# Altium project 24V-70A-Power-Board-v1.0.PrjPcb (part 4 of 8)
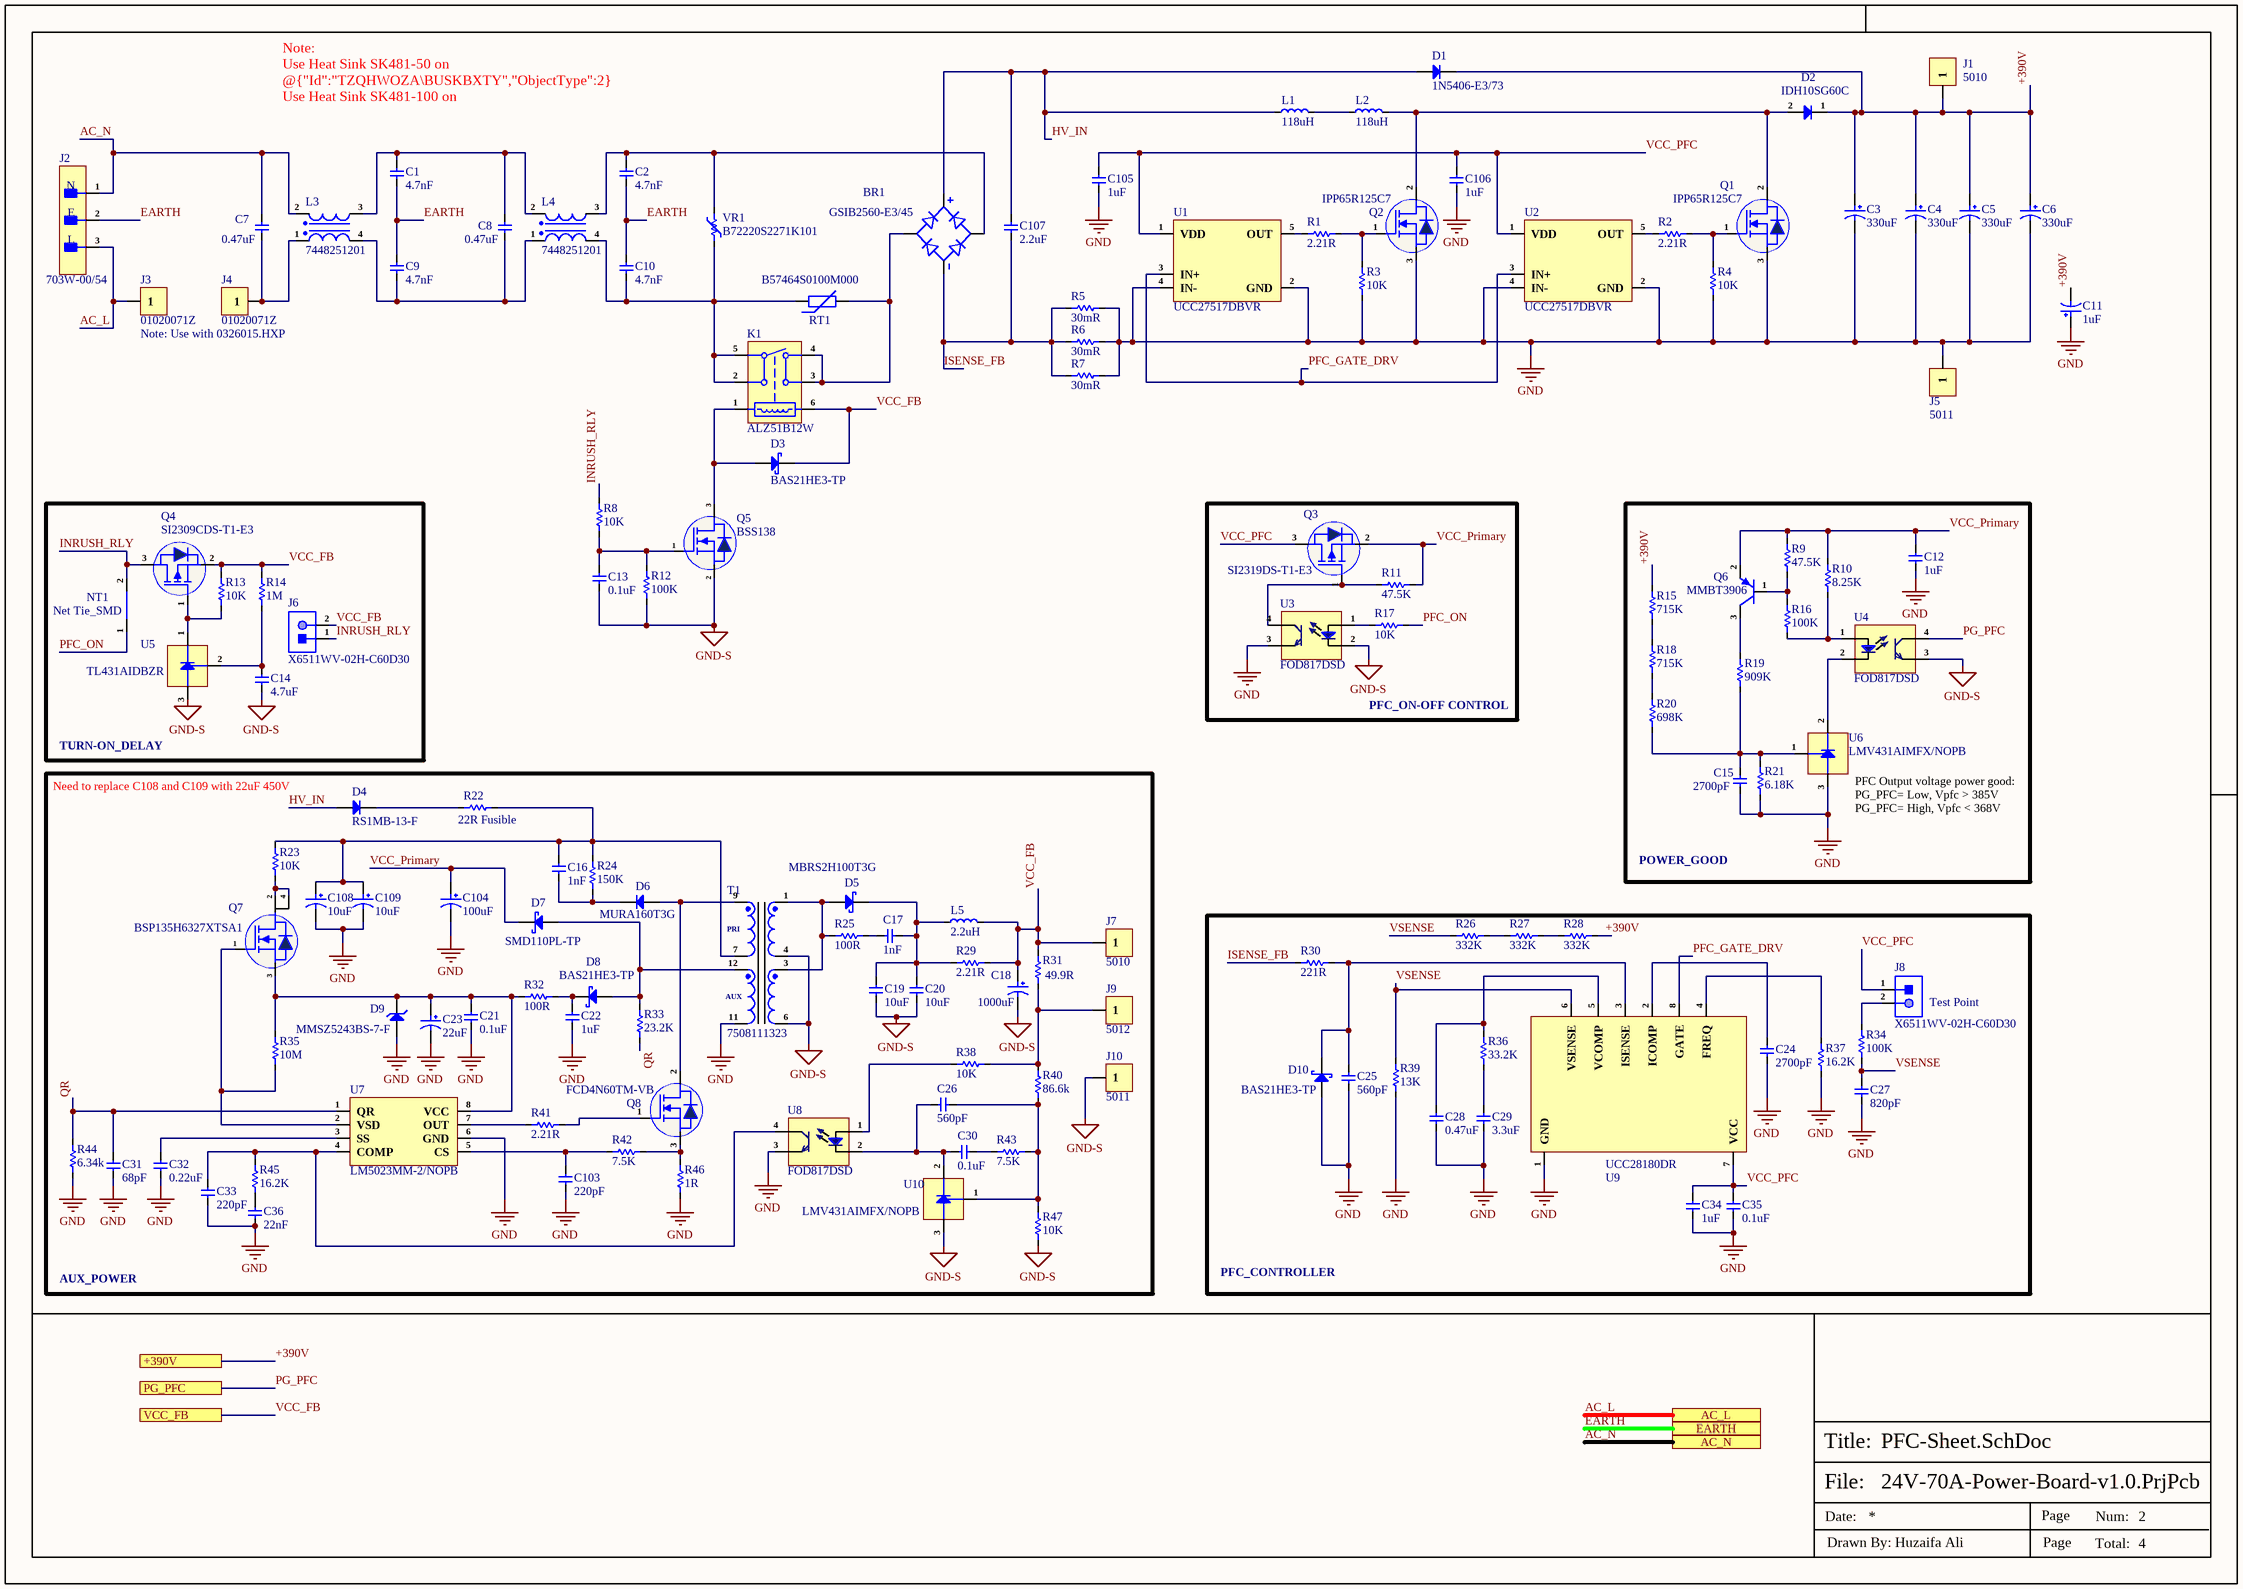
[diagram p6: PFC-Sheet.SchDoc]

## Sheet PFC-Sheet.SchDoc (continued)
### Library data of the parts
BR1 = GSIB2560-E3/45: BRIDGE RECT 1P 600V 3.5A GSIB-5S; Manufacturer: Vishay Semiconductors; Item Type: Bridge Rectifier; Supplier: Mouser; LCSC Part Number: C2838498; Manufacturer Part Number: GSIB2560-E3/45; RoHS: Yes; Stock: 2131; Pricing: 1=2.95, 10=2.01, 50=2.01, 100=1.62, 1000=1.5, 10000=1.49 (USD); ComponentLink1URL: https://datasheet.ciiva.com/4238/gsib25xx-4238464.pdf?src-supplier=Arrow+Electronics; ComponentLink1Description: https://datasheet.ciiva.com/4238/gsib25xx-4238464.pdf?src-supplier=Arrow+Electronics; ComponentLink2URL: https://datasheet.ciiva.com/4238/gsib25xx-4238478.pdf?src-supplier=Arrow+Electronics; ComponentLink2Description: https://datasheet.ciiva.com/4238/gsib25xx-4238478.pdf?src-supplier=Arrow+Electronics; ComponentLink3URL: https://datasheet.ciiva.com/17099/gsib2560-e3-45-17099405.pdf?src-supplier=Allied+Electronics; ComponentLink3Description: https://datasheet.ciiva.com/17099/gsib2560-e3-45-17099405.pdf?src-supplier=Allied+Electronics; ComponentLink4URL: https://datasheet.ciiva.com/15145/getdatasheetpartid-91689-15145262.pdf?src-supplier=Verical; ComponentLink4Description: https://datasheet.ciiva.com/15145/getdatasheetpartid-91689-15145262.pdf?src-supplier=Verical; ComponentLink5URL: https://datasheet.ciiva.com/26323/gsib25xx-26323910.pdf?src-supplier=Element14; ComponentLink5Description: https://datasheet.ciiva.com/26323/gsib25xx-26323910.pdf?src-supplier=Element14; ComponentLink6URL: https://datasheet.ciiva.com/1175/gsib25xx-1175169.pdf?src-supplier=Element14; ComponentLink6Description: https://datasheet.ciiva.com/1175/gsib25xx-1175169.pdf?src-supplier=Element14; ComponentLink7URL: https://datasheet.ciiva.com/11196/gsib25xx-11196312.pdf?src-supplier=Avnet; ComponentLink7Description: https://datasheet.ciiva.com/11196/gsib25xx-11196312.pdf?src-supplier=Avnet; ComponentLink8URL: https://datasheet.ciiva.com/885/gsib25xx-885637.pdf?src-supplier=Digikey; ComponentLink8Description: https://datasheet.ciiva.com/885/gsib25xx-885637.pdf?src-supplier=Digikey; ComponentLink9URL: https://datasheet.ciiva.com/16387/gsib20xx-16387863.pdf?src-supplier=Future+Electronics; ComponentLink9Description: https://datasheet.ciiva.com/16387/gsib20xx-16387863.pdf?src-supplier=Future+Electronics
C1 C2 C9 C10 = C771U472MYWDBA7317: CAP CER 4.7NF X1/Y2 400V/250V; Manufacturer: KEMET; Item Type: Capacitors; Supplier: Mouser; Supplier Part Number: 80-C771U472MYWDB7317; Manufacturer Part Number: C771U472MYWDBA7317; RoHS: Yes; Stock: 2909; Pricing: 1=0.96, 10=0.607, 50=0.607, 100=0.495, 1000=0.342, 10000=0.307 (USD); RoHS Compliant: Yes
C3-C6 = 381LR331M450K052: CAP ALUM 330UF 20% 450V SNAP TH; Manufacturer: Cornell Dubilier; Item Type: Aluminum Electrolytic Capacitors; Supplier: Digikey; Manufacturer Part Number: 381LR331M450K052; RoHS: Yes; Stock: 7391; Pricing: 1=8.38, 10=5.898, 50=4.8932, 100=4.6875 (USD); ComponentLink1URL: https://datasheet.ciiva.com/101/381lr-101261.pdf?src-supplier=Digikey; ComponentLink1Description: https://datasheet.ciiva.com/101/381lr-101261.pdf?src-supplier=Digikey; ComponentLink2URL: https://datasheet.ciiva.com/5373/381lr-5373947.pdf?src-supplier=Mouser; ComponentLink2Description: https://datasheet.ciiva.com/5373/381lr-5373947.pdf?src-supplier=Mouser
C7 C8 = B32933A3474M000: CAP FILM 0.47UF 20% 305VAC RAD; Manufacturer: TDK EPCOS; Item Type: Capacitors; Dielectric Material: Polyester; Value: 470nF; Ratings: AEC-Q200,X2; Supplier: Digikey; Supplier Part Number: 495-75595-ND; Manufacturer Part Number: B32933A3474M000; RoHS: Yes; Stock: 1785; Pricing: 1=1.25, 10=0.938, 50=0.8558, 100=0.701, 510=0.55953, 1020=0.4937, 2550=0.46078, 5100=0.45713 (USD); Case/Package: Radial; Series: B32933; Termination: PC Pins; RoHS Compliant: Yes; ComponentLink1URL: https://en.tdk.eu/inf/20/20/ds/MKT_B32932_936.pdf?src-supplier=Digikey; ComponentLink1Description: https://en.tdk.eu/inf/20/20/ds/MKT_B32932_936.pdf?src-supplier=Digikey
C11 = R75PR4100AA30K: Cap Film 0.47uF 305VAC PET 20% (26.5 X 8.5 X 16.5mm) Radial 22.5mm 105°C Bulk; Manufacturer: KEMET; Item Type: Capacitors; Dielectric Material: Polyester; Value: 470nF; Ratings: AEC-Q200,X2; Supplier: Mouser; Supplier Part Number: 80-R75PR4100AA30K; Manufacturer Part Number: R75PR4100AA30K; RoHS: Yes; Stock: 3429; Pricing: 1=1.83, 10=1.31, 50=1.03, 100=0.854, 1000=0.846, 10000=0.846 (USD); ComponentLink1URL: https://datasheet.ciiva.com/13404/kem-f3106-r75-364632-13404539.pdf?src-supplier=Mouser; ComponentLink1Description: https://datasheet.ciiva.com/13404/kem-f3106-r75-364632-13404539.pdf?src-supplier=Mouser; Category: Film Capacitors; Case/Package: Radial; Series: B32933; Termination: PC Pins; RoHS Compliant: Yes; ComponentLink2URL: https://en.tdk.eu/inf/20/20/ds/MKT_B32932_936.pdf?src-supplier=Digikey; ComponentLink2Description: https://en.tdk.eu/inf/20/20/ds/MKT_B32932_936.pdf?src-supplier=Digikey
C12 C22 C34 C105 C106 = C1608X7R1E105K080AB: CAP CER 1UF 25V X7R 0603; Manufacturer: TDK; Item Type: Capacitors; Material: 4241ConductorMaterial; Tolerance: 10%; Supplier: Digikey; Manufacturer Part Number: C1608X7R1E105K080AB; RoHS: Yes; Stock: 239206; Pricing: 1=0.18, 10=0.103, 50=0.0722, 100=0.0627, 500=0.04664, 1000=0.04163 (USD); Mounting Technology: Surface Mount; Case/Package: 0603; Case Code (Metric): 1608; Case Code (Imperial): 0603; Dielectric Material: 4241ConductorMaterial; Min Operating Temperature: -55°C; Max Operating Temperature: 125°C; Value: 1uF; Package Quantity: 1; Voltage Rating: 25V; Packaging: Tape and Reel; Dielectric: X7R; Voltage: 25V; Series: C; Construction: Flat; Length: 1.6mm; Width: 0.031inch; Height: 0.8mm; Thickness: 0.037inch; Depth: 0.8mm; Radiation Hardening: No; Reach SVHC Compliant: No; Lead Free: Lead Free; RoHS Compliant: Yes; ComponentLink1URL: https://datasheet.ciiva.com/23802/1796654-23802776.pdf?src-supplier=Newark; ComponentLink1Description: https://datasheet.ciiva.com/23802/1796654-23802776.pdf?src-supplier=Newark; ComponentLink2URL: https://datasheet.ciiva.com/22725/1913358-22725530.pdf?src-supplier=Element14; ComponentLink2Description: https://datasheet.ciiva.com/22725/1913358-22725530.pdf?src-supplier=Element14; ComponentLink3URL: https://datasheet.ciiva.com/28693/mlcc-commercial-general-en-28693447.pdf?src-supplier=Element14; ComponentLink3Description: https://datasheet.ciiva.com/28693/mlcc-commercial-general-en-28693447.pdf?src-supplier=Element14; ComponentLink4URL: https://datasheet.ciiva.com/6290/tdkmlcccaprange-6290854.pdf?src-supplier=Digikey; ComponentLink4Description: https://datasheet.ciiva.com/6290/tdkmlcccaprange-6290854.pdf?src-supplier=Digikey; ComponentLink5URL: https://datasheet.ciiva.com/26834/getdatasheetpartid-727834-26834380.pdf?src-supplier=Verical; ComponentLink5Description: https://datasheet.ciiva.com/26834/getdatasheetpartid-727834-26834380.pdf?src-supplier=Verical
C13 C21 C30 C35 = CL10B104KB8WPNC: CAP CER 0.1UF 50V X7R 0603; Item Type: Capacitor; Material: 4241ConductorMaterial; Value: 100nF; Tolerance: 10%; LCSC Part Number: C307348; ComponentLink1Description: LCSC; Supplier: Rs; Supplier Part Number: 2575919; RoHS: Yes; Category: Ceramic Capacitors; Stock: 400; Pricing: 100=0.021, 500=0.019, 1000=0.015, 2000=0.01 (GBP); Mounting Technology: Surface Mount; Case/Package: 0603; Case Code (Metric): 1608; Case Code (Imperial): 0603; Min Operating Temperature: -55°C; Max Operating Temperature: 125°C; Packaging: Cut Tape; Voltage Rating: 50V; Series: CL; Voltage Rating (DC): 50V; Height: 900um; Ratings: AEC-Q200; RoHS Compliant: Yes; Lead Free: 5697LeadFree; ComponentLink2URL: http://www.farnell.com/datasheets/2710560.pdf?src-supplier=Farnell; ComponentLink2Description: http://www.farnell.com/datasheets/2710560.pdf?src-supplier=Farnell; ComponentLink3URL: http://www.samsungsem.com/kr/support/product-search/mlcc/CL10B104KB8WPNC.jsp?src-supplier=Digi-Key; ComponentLink3Description: http://www.samsungsem.com/kr/support/product-search/mlcc/CL10B104KB8WPNC.jsp?src-supplier=Digi-Key; ComponentLink4URL: http://www.farnell.com/datasheets/2710560.pdf?src-supplier=Element14; ComponentLink4Description: http://www.farnell.com/datasheets/2710560.pdf?src-supplier=Element14; ComponentLink5URL: https://datasheet.octopart.com/CL10B104KB8WPNC-Samsung-Electro-Mechanics-datasheet-120093645.pdf?src-supplier=Future+Electronics; ComponentLink5Description: https://datasheet.octopart.com/CL10B104KB8WPNC-Samsung-Electro-Mechanics-datasheet-120093645.pdf?src-supplier=Future+Electronics; ComponentLink6URL: http://www.farnell.com/datasheets/2710560.pdf?src-supplier=Newark; ComponentLink6Description: http://www.farnell.com/datasheets/2710560.pdf?src-supplier=Newark; ComponentLink7URL: http://www.samsungsem.com/servlet/FileDownload?type=spec&file=CL10B104KB8WPNC.pdf&src-supplier=Avnet; ComponentLink7Description: http://www.samsungsem.com/servlet/FileDownload?type=spec&file=CL10B104KB8WPNC.pdf&src-supplier=Avnet; ComponentLink8URL: https://datasheet.octopart.com/CL10B104KB8WPNC-Samsung-datasheet-8326407.pdf?src-supplier=TME; ComponentLink8Description: https://datasheet.octopart.com/CL10B104KB8WPNC-Samsung-datasheet-8326407.pdf?src-supplier=TME
C14 = C1608X5R1E475KT000E: CAP CER, 4.7 µF, 25 V, 0603; Manufacturer: TDK; Dielectric Material: Ceramic; Tolerance: 10%; Voltage Rating: 25V; Dielectric: X5R; Item Type: Capacitor; Supplier 1: Digi-Key; Manufacturer Part Number: C1608X5R1E475KT000E; RoHS: No; Supplier Part Number 1: 2220Y1000562GCT-ND; Supplier 2: RSComponents; Category: Ceramic Capacitors; Stock 2: 16120; Pricing 2: 100=0.23400, 200=0.21900, 1000=0.20700, 2000=0.18700 (GBP); Mount: Surface Mount; Case/Package: 0603; Weight: 7.1E-05oz; Case Code (Metric): 1608; Case Code (Imperial): 0603; Min Operating Temperature: -55°C; Max Operating Temperature: 85°C; Termination: SMD/SMT; Resistor Type: Ceramic; Packaging: Tape and Reel; Capacitance: 4.7uF; Package Quantity: 4000; Voltage Rating (DC): 25V; Length: 1.6mm; Width: 0.031inch; Height: 0.8mm; Thickness: 0.039inch; Depth: 0.8mm; Lead Free: Lead Free; REACH SVHC: No SVHC; ComponentLink1URL: https://datasheet.ciiva.com/48587/6print-detail-pdf-phplangenpart-noc1608x5r1e475k080acimp-unit-xmhz-48587141.pdf?src-supplier=Onlinecomponents.com; ComponentLink1Description: https://datasheet.ciiva.com/48587/6print-detail-pdf-phplangenpart-noc1608x5r1e475k080acimp-unit-xmhz-48587141.pdf?src-supplier=Onlinecomponents.com; ComponentLink2URL: https://datasheet.ciiva.com/24216/mlcc-commercial-general-en-24216326.pdf?src-supplier=Mouser; ComponentLink2Description: https://datasheet.ciiva.com/24216/mlcc-commercial-general-en-24216326.pdf?src-supplier=Mouser; ComponentLink3URL: https://datasheet.ciiva.com/48671/mlcc-commercial-general-en-48671304.pdf?src-supplier=Avnet; ComponentLink3Description: https://datasheet.ciiva.com/48671/mlcc-commercial-general-en-48671304.pdf?src-supplier=Avnet; Supplier Part Number 2: 9159158P; LCSC Part Number: C76615
C15 C24 = C1608C0G1H272J080AA: CAP CER 2700PF 50V C0G 0603; Manufacturer: TDK; Item Type: Capacitors; Dielectric Material: Ceramic; Value: 2.7nF; Tolerance: 5%; Supplier: Digikey; Supplier Part Number: 445-2669-1-ND; Manufacturer Part Number: C1608C0G1H272J080AA; RoHS: Yes; Stock: 2978; Pricing: 1=0.16, 10=0.091, 50=0.0638, 100=0.0554, 500=0.04098, 1000=0.03649 (USD); Mounting Technology: Surface Mount; Case/Package: 0603; Case Code (Metric): 1608; Case Code (Imperial): 0603; Weight: 7.1E-05oz; Min Operating Temperature: -55°C; Max Operating Temperature: 125°C; Voltage Rating: 50V; Packaging: Tape and Reel; Package Quantity: 4000; Voltage Rating (DC): 50V; Dielectric: C0G; Termination: SMD/SMT; Series: C; Construction: Flat; Length: 1.6mm; Width: 0.8mm; Height: 0.8mm; Depth: 0.8mm; Reach SVHC Compliant: No; Lead Free: Lead Free; RoHS Compliant: Yes; ComponentLink1URL: https://datasheet.ciiva.com/24221/c1608c0g1h272j080aa-264507-24221179.pdf?src-supplier=Mouser; ComponentLink1Description: https://datasheet.ciiva.com/24221/c1608c0g1h272j080aa-264507-24221179.pdf?src-supplier=Mouser; ComponentLink2URL: https://datasheet.ciiva.com/6291/tdkmlcccaprange-6291545.pdf?src-supplier=Digikey; ComponentLink2Description: https://datasheet.ciiva.com/6291/tdkmlcccaprange-6291545.pdf?src-supplier=Digikey; ComponentLink3URL: https://datasheet.ciiva.com/6291/tdkmlcccaprange-6291541.pdf?src-supplier=Digikey; ComponentLink3Description: https://datasheet.ciiva.com/6291/tdkmlcccaprange-6291541.pdf?src-supplier=Digikey; ComponentLink4URL: https://datasheet.ciiva.com/6291/tdkmlcccaprange-6291550.pdf?src-supplier=Digikey; ComponentLink4Description: https://datasheet.ciiva.com/6291/tdkmlcccaprange-6291550.pdf?src-supplier=Digikey; ComponentLink5URL: https://datasheet.ciiva.com/28576/1744655-28576939.pdf?src-supplier=Element14; ComponentLink5Description: https://datasheet.ciiva.com/28576/1744655-28576939.pdf?src-supplier=Element14
C16 C17 = C2012X7R2E102K085AA: CAP CER 1000PF 250V X7R 0805; Manufacturer: TDK; Item Type: Capacitor; Material: 4241ConductorMaterial; Supplier: Digikey; LCSC Part Number: C2182167; Manufacturer Part Number: C2012X7R2E102K085AA; RoHS: Yes; Stock: 74527; Pricing: 1=0.16, 10=0.091, 50=0.0638, 100=0.0554, 500=0.04098, 1000=0.03649 (USD); ComponentLink1URL: https://datasheet.ciiva.com/24218/c2012x7r2e102k085aa-264958-24218883.pdf?src-supplier=Mouser; ComponentLink1Description: https://datasheet.ciiva.com/24218/c2012x7r2e102k085aa-264958-24218883.pdf?src-supplier=Mouser; ComponentLink2URL: https://datasheet.ciiva.com/11788/0900766b80fc5cba-11788133.pdf?src-supplier=Rs; ComponentLink2Description: https://datasheet.ciiva.com/11788/0900766b80fc5cba-11788133.pdf?src-supplier=Rs; ComponentLink3URL: https://datasheet.ciiva.com/22684/1484596-22684118.pdf?src-supplier=Element14; ComponentLink3Description: https://datasheet.ciiva.com/22684/1484596-22684118.pdf?src-supplier=Element14; ComponentLink4URL: https://datasheet.ciiva.com/28602/1484596-28602278.pdf?src-supplier=Element14; ComponentLink4Description: https://datasheet.ciiva.com/28602/1484596-28602278.pdf?src-supplier=Element14; ComponentLink5URL: https://datasheet.ciiva.com/16390/e413-c-16390590.pdf?src-supplier=Future+Electronics; ComponentLink5Description: https://datasheet.ciiva.com/16390/e413-c-16390590.pdf?src-supplier=Future+Electronics
C18 = EEU-FM1C102B: CAP ALUM 1000UF 20% 16V RADIAL; Manufacturer: Panasonic; Item Type: Capacitors; Value: 1mF; Ripple Current: 2.18A; Impedance: 19mR; Life (Hours): 5000Hour; Lead Diameter: 0.6mm; Supplier: Mouser; LCSC Part Number: C1588681; Manufacturer Part Number: EEU-FM1C102B; RoHS: Yes; Stock: 1140; Pricing: 1=0.79, 10=0.466, 50=0.466, 100=0.372, 1000=0.26, 10000=0.219 (USD); Mounting Technology: Through Hole; Case/Package: Radial; Min Operating Temperature: -40°C; Max Operating Temperature: 105°C; Voltage Rating: 16V; Tolerance: 20%; Packaging: Ammo Pack; Package Quantity: 500; Voltage Rating (DC): 16V; ESR (Equivalent Series Resistance): 19mR; Termination: Radial; Series: FM; Diameter: 10mm; Length: 20mm; Height: 20mm; Lead Pitch: 5mm; Height - Seated (Max): 0.866inch; Radiation Hardening: No; Lead Free: Lead Free; RoHS Compliant: Yes; ComponentLink1URL: https://datasheet.ciiva.com/24025/a-e-461514-24025941.pdf?src-supplier=Mouser; ComponentLink1Description: https://datasheet.ciiva.com/24025/a-e-461514-24025941.pdf?src-supplier=Mouser; ComponentLink2URL: https://datasheet.ciiva.com/11677/aba0000ce108-11677710.pdf?src-supplier=Avnet; ComponentLink2Description: https://datasheet.ciiva.com/11677/aba0000ce108-11677710.pdf?src-supplier=Avnet
C19 C20 = C3225X7R1E106MTJ00N: CAP CER 10UF 25V X7R 1210; Manufacturer: TDK Corporation; Manufacturer Part Number: C3225X7R1E106M250AC; Item Type: Capacitors; Package: 1210; LCSC Part Number: C694198; ComponentLink1Description: LCSC; ComponentLink1URL: https://www.lcsc.com/product-detail/Multilayer-Ceramic-Capacitors-MLCC-SMD-SMT_TDK-C3225X7R1E106MTJ00N_C694198.html
C23 = EEE-FK1H220P: CAP ALUM 22UF 20% 50V SMD; Manufacturer: Panasonic; Item Type: Capacitors; Dielectric Material: 158ConductorMaterial; Ripple Current (AC): 165mA; Impedance: 880mR; Life (Hours): 2000Hour; Leakage Current: 3uA; Dissipation Factor: 10%; Supplier: Mouser; LCSC Part Number: C128458; Manufacturer Part Number: EEE-FK1H220P; RoHS: Yes; Stock: 69938; Pricing: 1=0.42, 10=0.227, 50=0.227, 100=0.147, 1000=0.117, 10000=0.098 (USD); Mounting Technology: Surface Mount,PCB; Case/Package: Radial; Pins: 2; Min Operating Temperature: -55°C; Max Operating Temperature: 105°C; Value: 22uF; Tolerance: 20%; Voltage Rating: 50V; Packaging: Tape and Reel; Ripple Current: 165mA; Voltage Rating (DC): 50V; ESR (Equivalent Series Resistance): 880mR; Termination: SMD/SMT; Voltage: 50V; Package Quantity: 1000; Series: FK; Construction: Cylindrical; Diameter: 6.3mm; Length: 5.8mm; Width: 7.8mm; Height: 5.8mm; Ratings: AEC-Q200; Radiation Hardening: No; Reach SVHC Compliant: No; Lead Free: Lead Free; RoHS Compliant: Yes; ComponentLink1URL: https://datasheet.ciiva.com/11777/0900766b80e4e8b0-11777316.pdf?src-supplier=Rs; ComponentLink1Description: https://datasheet.ciiva.com/11777/0900766b80e4e8b0-11777316.pdf?src-supplier=Rs; ComponentLink2URL: https://datasheet.ciiva.com/43463/58258-43463528.pdf?src-supplier=Farnell; ComponentLink2Description: https://datasheet.ciiva.com/43463/58258-43463528.pdf?src-supplier=Farnell; ComponentLink3URL: https://datasheet.ciiva.com/46388/58258-46388569.pdf?src-supplier=Element14; ComponentLink3Description: https://datasheet.ciiva.com/46388/58258-46388569.pdf?src-supplier=Element14; ComponentLink4URL: https://datasheet.ciiva.com/28691/1676921-28691087.pdf?src-supplier=Element14; ComponentLink4Description: https://datasheet.ciiva.com/28691/1676921-28691087.pdf?src-supplier=Element14; ComponentLink5URL: https://datasheet.ciiva.com/24072/aba0000ce120-24072156.pdf?src-supplier=Mouser; ComponentLink5Description: https://datasheet.ciiva.com/24072/aba0000ce120-24072156.pdf?src-supplier=Mouser; ComponentLink6URL: https://datasheet.ciiva.com/14605/70258115-14605607.pdf?src-supplier=Allied+Electronics; ComponentLink6Description: https://datasheet.ciiva.com/14605/70258115-14605607.pdf?src-supplier=Allied+Electronics; ComponentLink7URL: https://datasheet.ciiva.com/14607/70258115-14607833.pdf?src-supplier=Allied+Electronics; ComponentLink7Description: https://datasheet.ciiva.com/14607/70258115-14607833.pdf?src-supplier=Allied+Electronics; ComponentLink8URL: https://datasheet.ciiva.com/43485/1676921-43485511.pdf?src-supplier=Farnell; ComponentLink8Description: https://datasheet.ciiva.com/43485/1676921-43485511.pdf?src-supplier=Farnell; ComponentLink9URL: https://datasheet.ciiva.com/46388/1676921-46388589.pdf?src-supplier=Element14; ComponentLink9Description: https://datasheet.ciiva.com/46388/1676921-46388589.pdf?src-supplier=Element14; ComponentLink10URL: https://datasheet.ciiva.com/6085/1676921-6085161.pdf?src-supplier=Farnell; ComponentLink10Description: https://datasheet.ciiva.com/6085/1676921-6085161.pdf?src-supplier=Farnell; ComponentLink11URL: https://datasheet.ciiva.com/46376/1676921-46376472.pdf?src-supplier=Element14; ComponentLink11Description: https://datasheet.ciiva.com/46376/1676921-46376472.pdf?src-supplier=Element14; ComponentLink12URL: https://datasheet.ciiva.com/16449/aba0000ce120-16449096.pdf?src-supplier=Future+Electronics; ComponentLink12Description: https://datasheet.ciiva.com/16449/aba0000ce120-16449096.pdf?src-supplier=Future+Electronics
C25 C26 = 06035A561JAT2A: CAP CER 560PF 50V C0G/NP0 0603; Manufacturer: Kyocera AVX; Item Type: Capacitor; Supplier: Future Electronics; LCSC Part Number: C597173; Manufacturer Part Number: 06035A561JAT2A; RoHS: Yes; Stock: 180000; Pricing: 4000=0.0172, 16000=0.0165, 40000=0.0091, 60000=0.0158, 100000=0.0088, 120000=0.0155, 160000=0.0083, 300000=0.0148 (USD); ComponentLink1URL: https://datasheet.ciiva.com/27051/1032160-27051276.pdf?src-supplier=Jameco; ComponentLink1Description: https://datasheet.ciiva.com/27051/1032160-27051276.pdf?src-supplier=Jameco; ComponentLink2URL: https://datasheet.ciiva.com/16286/ccog-16286446.pdf?src-supplier=Future+Electronics; ComponentLink2Description: https://datasheet.ciiva.com/16286/ccog-16286446.pdf?src-supplier=Future+Electronics; ComponentLink3URL: https://datasheet.ciiva.com/150/ccog-150647.pdf?src-supplier=Digikey; ComponentLink3Description: https://datasheet.ciiva.com/150/ccog-150647.pdf?src-supplier=Digikey; ComponentLink4URL: https://datasheet.ciiva.com/150/ccog-150648.pdf?src-supplier=Digikey; ComponentLink4Description: https://datasheet.ciiva.com/150/ccog-150648.pdf?src-supplier=Digikey; ComponentLink5URL: https://datasheet.ciiva.com/150/ccog-150649.pdf?src-supplier=Digikey; ComponentLink5Description: https://datasheet.ciiva.com/150/ccog-150649.pdf?src-supplier=Digikey; ComponentLink6URL: https://datasheet.ciiva.com/2987/ccog-2987809.pdf?src-supplier=Avnet; ComponentLink6Description: https://datasheet.ciiva.com/2987/ccog-2987809.pdf?src-supplier=Avnet; ComponentLink7URL: https://datasheet.ciiva.com/2987/ccog-2987810.pdf?src-supplier=Avnet; ComponentLink7Description: https://datasheet.ciiva.com/2987/ccog-2987810.pdf?src-supplier=Avnet; ComponentLink8URL: https://datasheet.ciiva.com/5423/ccog-5423589.pdf?src-supplier=Mouser; ComponentLink8Description: https://datasheet.ciiva.com/5423/ccog-5423589.pdf?src-supplier=Mouser; ComponentLink9URL: https://datasheet.ciiva.com/14598/70001039-14598549.pdf?src-supplier=Allied+Electronics; ComponentLink9Description: https://datasheet.ciiva.com/14598/70001039-14598549.pdf?src-supplier=Allied+Electronics; ComponentLink10URL: https://datasheet.ciiva.com/1124/425357-1124836.pdf?src-supplier=Element14; ComponentLink10Description: https://datasheet.ciiva.com/1124/425357-1124836.pdf?src-supplier=Element14; ComponentLink11URL: https://datasheet.ciiva.com/1124/425357-1124837.pdf?src-supplier=Element14; ComponentLink11Description: https://datasheet.ciiva.com/1124/425357-1124837.pdf?src-supplier=Element14
C27 = CC0603JRNPO9BN821: CAP CER 820PF 50V C0G/NPO 0603; Manufacturer: Yageo; Item Type: Capacitors; Tolerance: 5%; Dielectric: C0G; Supplier: Arrow Electronics; LCSC Part Number: C107057; Manufacturer Part Number: CC0603JRNPO9BN821; RoHS: Yes; Stock: 772000; Pricing: 4000=0.0129, 24000=0.0087, 48000=0.0086 (USD); Mounting Technology: Surface Mount; Case/Package: 0603; Pins: 2; Case Code (Imperial): 0603; Case Code (Metric): 1608; Min Operating Temperature: -55°C; Max Operating Temperature: 125°C; Packaging: Tape and Reel; Value: 820pF; Voltage Rating: 50V; Voltage Rating (DC): 50V; Termination: SMD/SMT; Series: CC; Length: 1.6mm; Width: 0.031inch; Height: 0.8mm; Thickness: 0.035inch; Depth: 0.8mm; Radiation Hardening: No; Lead Free: Lead Free; RoHS Compliant: Yes; ComponentLink1URL: https://datasheet.ciiva.com/26829/getdatasheetpartid-403541-26829388.pdf?src-supplier=Verical; ComponentLink1Description: https://datasheet.ciiva.com/26829/getdatasheetpartid-403541-26829388.pdf?src-supplier=Verical
C28 = CL10A474KB8NNNC: CAP CER 0.47UF 50V X5R 0603; Manufacturer: Samsung; Tolerance: 10%; Capacitance: 470nF; Supplier 1: Arrow Electronics; Manufacturer Part Number: CL10A474KB8NNNC; RoHS: Yes; Category: Ceramic Capacitors; Stock 1: 196000; Pricing 1: 200000=0.04290, 300000=0.04250, 400000=0.04210, 500000=0.04170, 1000000=0.04120, 2000000=0.04080 (USD); Mount: Surface Mount; Case/Package: 0603; Case Code (Metric): 1608; Case Code (Imperial): 0603; Min Operating Temperature: -55°C; Max Operating Temperature: 85°C; Packaging: Tape and Reel; Package Quantity: 1; Voltage Rating: 50V; Dielectric: X5R; Series: CL; Construction: Flat; Voltage Rating (DC): 50V; Length: 1.6mm; Width: 0.031inch; Height: 0.8mm; Thickness: 0.035inch; Depth: 0.8mm; Radiation Hardening: No; RoHS Compliant: Yes; Lead Free: Lead Free; ComponentLink1URL: https://datasheet.ciiva.com/25798/cl10a474kb8nnnc-25798516.pdf?src-supplier=Digi-Key; ComponentLink1Description: https://datasheet.ciiva.com/25798/cl10a474kb8nnnc-25798516.pdf?src-supplier=Digi-Key; ComponentLink2URL: https://datasheet.ciiva.com/15195/getdatasheetpartid-353290-15195713.pdf?src-supplier=Verical; ComponentLink2Description: https://datasheet.ciiva.com/15195/getdatasheetpartid-353290-15195713.pdf?src-supplier=Verical; Supplier Part Number 1: CL10A474KB8NNNC; LCSC Part Number: C170149
C29 = C1210C335K5RAC7800: CAP CER 3.3UF 50V X7R 1210; Manufacturer: KEMET; Item Type: Capacitor; Manufacturer Part Number: C1210C335K5RAC7800; Package: 1210
C31 = CGA3E2C0G2A680JT0Y0N: CAP CER 68PF 100V C0G 0603; Manufacturer: TDK; Item Type: Capacitor; Manufacturer Part Number: CGA3E2C0G2A680JT0Y0N; Package: 0603; LCSC Part Number: C694224
C32 = CC0603KRX7R7BB224: CAP CER 0.22UF 16V X7R 0603; Manufacturer: Yageo; Item Type: Capacitor; Material: 4241ConductorMaterial; Supplier: Digikey; Supplier Part Number: 311-1426-1-ND; Manufacturer Part Number: CC0603KRX7R7BB224; RoHS: Yes; Stock: 45192; Pricing: 1=0.1, 10=0.058, 50=0.0334, 100=0.0258, 500=0.01944, 1000=0.01528 (USD); Voltage Rating (DC): 16V; Lead Free: 5697LeadFree; Halogen Free: 5694HalogenFree; ComponentLink1URL: https://datasheet.ciiva.com/11788/0900766b80d84f1d-11788400.pdf?src-supplier=Rs; ComponentLink1Description: https://datasheet.ciiva.com/11788/0900766b80d84f1d-11788400.pdf?src-supplier=Rs; ComponentLink2URL: https://datasheet.ciiva.com/176/mlccorderingcode-176606.pdf?src-supplier=Digikey; ComponentLink2Description: https://datasheet.ciiva.com/176/mlccorderingcode-176606.pdf?src-supplier=Digikey; ComponentLink3URL: https://datasheet.ciiva.com/176/mlccorderingcode-176607.pdf?src-supplier=Digikey; ComponentLink3Description: https://datasheet.ciiva.com/176/mlccorderingcode-176607.pdf?src-supplier=Digikey; ComponentLink4URL: https://datasheet.ciiva.com/176/mlccorderingcode-176608.pdf?src-supplier=Digikey; ComponentLink4Description: https://datasheet.ciiva.com/176/mlccorderingcode-176608.pdf?src-supplier=Digikey
C33 C103 = C1608C0G1H221JT000N: CAP CER 220PF 50V C0G 0603; Manufacturer: TDK Corporation; Manufacturer Part Number: C1608C0G1H221J080AA; Item Type: Capacitors; Package: 0603; LCSC Part Number: C695131; ComponentLink1Description: LCSC; ComponentLink1URL: https://www.lcsc.com/product-detail/Multilayer-Ceramic-Capacitors-MLCC-SMD-SMT_TDK-C1608C0G1H221JT000N_C695131.html
C36 = CGA3E2X7R2A223K080AA: CAP CER 0.022UF 100V X7R 0603; Manufacturer: TDK; Tolerance: 10%; Item Type: Capacitor; Supplier 1: Digi-Key; Manufacturer Part Number: CGA3E2X7R2A223K080AA; RoHS: Yes; Category: Ceramic Capacitors; Stock 1: 56079; Pricing 1: 1=0.11000, 10=0.07600, 50=0.04340, 100=0.03590, 500=0.02516, 1000=0.02083 (USD); Mount: Surface Mount; Case/Package: 0603; Case Code (Metric): 1608; Case Code (Imperial): 0603; Weight: 7.1E-05oz; Min Operating Temperature: -55°C; Max Operating Temperature: 125°C; Capacitance: 22nF; Voltage Rating: 100V; Packaging: Tape and Reel; Voltage Rating (DC): 100V; Dielectric: X7R; Termination: SMD/SMT; Series: CGA; Package Quantity: 1; Resistor Type: Ceramic; Length: 1.6mm; Width: 0.031inch; Height: 0.8mm; Thickness: 0.035inch; Depth: 0.8mm; Ratings: AEC-Q200; RoHS Compliant: Yes; REACH SVHC: No SVHC; ComponentLink1URL: https://datasheet.ciiva.com/22725/1735406-22725648.pdf?src-supplier=Element14; ComponentLink1Description: https://datasheet.ciiva.com/22725/1735406-22725648.pdf?src-supplier=Element14; ComponentLink2URL: https://datasheet.ciiva.com/24218/cga3e2x7r2a223k080aa-266292-24218959.pdf?src-supplier=Mouser; ComponentLink2Description: https://datasheet.ciiva.com/24218/cga3e2x7r2a223k080aa-266292-24218959.pdf?src-supplier=Mouser; ComponentLink3URL: https://datasheet.ciiva.com/7975/1807242-7975349.pdf?src-supplier=Element14; ComponentLink3Description: https://datasheet.ciiva.com/7975/1807242-7975349.pdf?src-supplier=Element14; Supplier Part Number 1: 445-5814-1-ND; LCSC Part Number: C2167165
C104 = 25SVPF100M: CAP ALUM POLY 100UF 20% 25V SMD; Manufacturer: Panasonic; Ripple Current: 3.2A; ESR (Equivalent Series Resistance): 24mR; Leakage Current: 500uA; Life (Hours): 5000Hour; Dissipation Factor: 12%; Item Type: Capacitor; Supplier 1: Digi-Key; Manufacturer Part Number: 25SVPF100M; RoHS: Yes; Category: Aluminum Electrolytic Capacitors; Stock 1: 5809; Pricing 1: 1=1.68000, 10=1.32800, 50=1.15080, 100=0.99590, 500=0.75246 (USD); Mount: Surface Mount; Case/Package: Radial; Number of Pins: 7; Min Operating Temperature: -55°C; Max Operating Temperature: 105°C; Capacitance: 100uF; Tolerance: 20%; Voltage Rating: 25V; Ripple Current (AC): 3.2A; Packaging: Tape and Reel; Package Quantity: 1000; Voltage Rating (DC): 25V; Termination: SMD/SMT; Voltage: 25V; Series: OS-CON, SVPF; Diameter: 8mm; Length: 6.9mm; Height: 6.9mm; Height - Seated (Max): 0.276inch; Reach SVHC Compliant: Yes; Lead Free: Lead Free; RoHS Compliant: Yes; ComponentLink1URL: https://datasheet.ciiva.com/25746/1734360-25746518.pdf?src-supplier=Farnell; ComponentLink1Description: https://datasheet.ciiva.com/25746/1734360-25746518.pdf?src-supplier=Farnell; ComponentLink2URL: https://datasheet.ciiva.com/22746/1734360-22746213.pdf?src-supplier=Element14; ComponentLink2Description: https://datasheet.ciiva.com/22746/1734360-22746213.pdf?src-supplier=Element14; ComponentLink3URL: https://datasheet.ciiva.com/24064/svpf-os-262415-24064540.pdf?src-supplier=Mouser; ComponentLink3Description: https://datasheet.ciiva.com/24064/svpf-os-262415-24064540.pdf?src-supplier=Mouser; Supplier Part Number 1: P123675CT-ND; LCSC Part Number: C136279
C107 = ECW-FA2J225J: CAP FILM 2.2UF 5% 630VDC RADIAL; Manufacturer: Panasonic; Item Type: Capacitors; Dielectric Material: PP; Voltage Rating (DC): 630V; Supplier: Mouser; Supplier Part Number: 667-ECW-FA2J225J; Manufacturer Part Number: ECW-FA2J225J; RoHS: Yes; Stock: 55; Pricing: 1=1.91, 10=1.33, 50=1.07, 100=0.965, 1000=0.75, 10000=0.75 (USD); Mounting Technology: Through Hole; Case/Package: Radial; Min Operating Temperature: -40°C; Max Operating Temperature: 105°C; Value: 2.2uF; Tolerance: 5%; Packaging: Bulk; Package Quantity: 400; Termination: PC Pins; Dielectric: PP; Series: ECW-F(A); Voltage Rating: 630V; Length: 26mm; Width: 16.3mm; Height: 21.4mm; Lead Pitch: 22.5mm; Reach SVHC Compliant: Unknown; ComponentLink1URL: https://datasheet.ciiva.com/15908/abd0000ce47-15908716.pdf?src-supplier=Onlinecomponents.com; ComponentLink1Description: https://datasheet.ciiva.com/15908/abd0000ce47-15908716.pdf?src-supplier=Onlinecomponents.com; ComponentLink2URL: https://datasheet.ciiva.com/30167/44abd0000ce47-30167191.pdf?src-supplier=Onlinecomponents.com; ComponentLink2Description: https://datasheet.ciiva.com/30167/44abd0000ce47-30167191.pdf?src-supplier=Onlinecomponents.com; ComponentLink3URL: https://datasheet.ciiva.com/6282/abd0000ce47-6282218.pdf?src-supplier=Digikey; ComponentLink3Description: https://datasheet.ciiva.com/6282/abd0000ce47-6282218.pdf?src-supplier=Digikey
C108 C109 = ERK2GM100G10OT: 10uF 400V ±20% Plugin,D10xL10mm Aluminum Electrolytic Capacitors - Leaded ROHS; Manufacturer: AISHI(Aihua Group); ComponentLink1Description: LCSC; ComponentLink1URL: https://www.lcsc.com/product-detail/Aluminum-Electrolytic-Capacitors-Leaded_AISHI-Aihua-Group-ERK2GM100G10OT_C112498.html; Manufacturer Part Number: ERK2GM100G10OT; Package: Plugin,D10xL10mm; LCSC Part Number: C112498; Item Type: Electrolytic Capacitor
D1 = 1N5406-E3/73: DIODE GEN PURP 600V 3A DO201AD; Manufacturer: Vishay Semiconductors; Max Reverse Current: 5uA; Max Surge Current: 200A; Supplier: Mouser; LCSC Part Number: C467496; Manufacturer Part Number: 1N5406-E3/73; RoHS: Yes; Item Type: Diode; Stock: 23612; Pricing: 1=0.53, 10=0.453, 50=0.453, 100=0.315, 1000=0.214, 10000=0.16 (USD); Mounting Technology: Through Hole; Case/Package: DO-201AD; Contact Plating: Tin,Matte; Min Operating Temperature: -50°C; Max Operating Temperature: 150°C; Forward Current: 3A; Package Quantity: 1000; Packaging: Tape and Reel; Average Rectified Current: 3A; Max Repetitive Reverse Voltage (Vrrm): 600V; Peak Non-Repetitive Surge Current: 200A; Max Reverse Voltage (DC): 600V; Reverse Voltage: 600V; Series: -; Radiation Hardening: No; ComponentLink1URL: http://www.mouser.com/ds/2/427/1n5400-240276.pdf?src-supplier=Mouser; ComponentLink1Description: http://www.mouser.com/ds/2/427/1n5400-240276.pdf?src-supplier=Mouser; ComponentLink2URL: http://www.vishay.com/docs/88516/1n5400.pdf?src-supplier=Digikey; ComponentLink2Description: http://www.vishay.com/docs/88516/1n5400.pdf?src-supplier=Digikey; ComponentLink3URL: http://www.vishay.com/docs/88516/1n5400.pdf?src-supplier=Avnet; ComponentLink3Description: http://www.vishay.com/docs/88516/1n5400.pdf?src-supplier=Avnet
D2 = IDH10SG60C: 600V 1.8V@10A 10A TO-220-2 SiC Diodes ROHS; Manufacturer: Infineon; Supplier: Mouser; LCSC Part Number: C535874; Manufacturer Part Number: IDH10SG60C; RoHS: Yes; Item Type: Diodes; Stock: 239; Pricing: 1=5.14, 10=4.32, 50=4.32, 100=3.49, 1000=2.66, 10000=2.5 (USD); ComponentLink1URL: https://datasheet.ciiva.com/924/infineon-idh10sg60c-ds-v02-04-en-924234.pdf?src-supplier=Digikey; ComponentLink1Description: https://datasheet.ciiva.com/924/infineon-idh10sg60c-ds-v02-04-en-924234.pdf?src-supplier=Digikey; ComponentLink2URL: https://datasheet.ciiva.com/16386/idh10sg60c-rev2-4-78863-16386579.pdf?src-supplier=Mouser; ComponentLink2Description: https://datasheet.ciiva.com/16386/idh10sg60c-rev2-4-78863-16386579.pdf?src-supplier=Mouser; ComponentLink3URL: https://datasheet.ciiva.com/8300/infineon-idh10sg60c-ds-v02-04-en-8300971.pdf?src-supplier=Avnet; ComponentLink3Description: https://datasheet.ciiva.com/8300/infineon-idh10sg60c-ds-v02-04-en-8300971.pdf?src-supplier=Avnet
D3 D8 D10 = BAS21HE3-TP: 200V Independent Type 1.25V@200mA 50ns 200mA SOT-23 Switching Diodes ROHS; Manufacturer: MCC; Item Type: Diode; Manufacturer Part Number: BAS21HE3-TP; Package: SOT-23; LCSC Part Number: C3313195; ComponentLink1Description: LCSC; ComponentLink1URL: https://www.lcsc.com/product-detail/Switching-Diodes_MCC-Micro-Commercial-Components-BAS21HE3-TP_C3313195.html
D4 = RS1MB-13-F: DIODE GEN PURP 1KV 1A SMB; Manufacturer: Diodes; Max Reverse Current: 5uA; Reverse Recovery Time: 500ns; Peak Non-Repetitive Surge Current: 30A; Forward Voltage: 1.3V; Polarity: Standard; Value: 15pF; Supplier: Future Electronics; LCSC Part Number: C154864; Manufacturer Part Number: RS1MB-13-F; RoHS: Yes; Item Type: Diodes; Stock: 45000; Pricing: 3000=0.0825, 6000=0.093, 9000=0.0794, 12000=0.0905, 15000=0.078, 30000=0.0761, 60000=0.0732 (USD); Mounting Technology: Surface Mount; Case/Package: SMB; Pins: 2; Weight: 0.00328oz; Min Operating Temperature: -65°C; Max Operating Temperature: 150°C; Package Quantity: 3000; Packaging: Tape and Reel; Forward Current: 1A; Max Repetitive Reverse Voltage (Vrrm): 1kV; Output Current: 1A; Series: -; Max Surge Current: 30A; Recovery Time: 500ns; Reverse Voltage (DC): 1kV; Average Rectified Current: 1A; Voltage Rating (DC): 1kV; Current Rating: 1A; Max Reverse Voltage (DC): 1kV; Reverse Recovery Time-Max: 500ns; Length: 4.57mm; Width: 3.94mm; Height: 2.42mm; Radiation Hardening: No; Lead Free: Lead Free; RoHS Compliant: Yes; ComponentLink1URL: https://datasheet.ciiva.com/8301/ds15002-8301721.pdf?src-supplier=Avnet; ComponentLink1Description: https://datasheet.ciiva.com/8301/ds15002-8301721.pdf?src-supplier=Avnet; ComponentLink2URL: https://datasheet.ciiva.com/26818/getdatasheetpartid-91887-26818092.pdf?src-supplier=Verical; ComponentLink2Description: https://datasheet.ciiva.com/26818/getdatasheetpartid-91887-26818092.pdf?src-supplier=Verical; ComponentLink3URL: https://datasheet.ciiva.com/8301/ds15002-8301350.pdf?src-supplier=Avnet; ComponentLink3Description: https://datasheet.ciiva.com/8301/ds15002-8301350.pdf?src-supplier=Avnet
D5 = MBRS2H100T3G: DIODE SCHOTTKY 100V 2A SMB; Manufacturer: ON Semiconductor; Supplier: Future Electronics; LCSC Part Number: C83299; Manufacturer Part Number: MBRS2H100T3G; RoHS: Yes; Item Type: Diode; Stock: 27500; Pricing: 2500=0.155, 5000=0.151, 7500=0.15, 10000=0.148, 12500=0.144 (USD); Lead Free: 5697LeadFree; Halogen Free: 5694HalogenFree; ComponentLink1URL: https://datasheet.ciiva.com/916/mbrs2h100-d-916033.pdf?src-supplier=Digikey; ComponentLink1Description: https://datasheet.ciiva.com/916/mbrs2h100-d-916033.pdf?src-supplier=Digikey; ComponentLink2URL: https://datasheet.ciiva.com/13084/mbrs2h100-d-76602-13084146.pdf?src-supplier=Mouser; ComponentLink2Description: https://datasheet.ciiva.com/13084/mbrs2h100-d-76602-13084146.pdf?src-supplier=Mouser; ComponentLink3URL: https://datasheet.ciiva.com/30479/0900766b812769c5-30479153.pdf?src-supplier=Rs; ComponentLink3Description: https://datasheet.ciiva.com/30479/0900766b812769c5-30479153.pdf?src-supplier=Rs; ComponentLink4URL: https://datasheet.ciiva.com/8292/mbrs2h100-d-8292460.pdf?src-supplier=Avnet; ComponentLink4Description: https://datasheet.ciiva.com/8292/mbrs2h100-d-8292460.pdf?src-supplier=Avnet; ComponentLink5URL: https://datasheet.ciiva.com/8294/mbrs2h100-d-8294965.pdf?src-supplier=Avnet; ComponentLink5Description: https://datasheet.ciiva.com/8294/mbrs2h100-d-8294965.pdf?src-supplier=Avnet; ComponentLink6URL: https://datasheet.ciiva.com/916/mbrs2h100-d-916034.pdf?src-supplier=Digikey; ComponentLink6Description: https://datasheet.ciiva.com/916/mbrs2h100-d-916034.pdf?src-supplier=Digikey; ComponentLink7URL: https://datasheet.ciiva.com/916/mbrs2h100-d-916035.pdf?src-supplier=Digikey; ComponentLink7Description: https://datasheet.ciiva.com/916/mbrs2h100-d-916035.pdf?src-supplier=Digikey
D6 = MURA160T3G: DIODE GEN PURP 600V 1A SMA; Manufacturer: ON Semiconductor; Forward Current: 2A; Max Reverse Current: 5uA; Max Surge Current: 30A; Forward Voltage: 1.25V; Recovery Time: 75ns; Polarity: Standard; Supplier: Future Electronics; LCSC Part Number: C50432; Manufacturer Part Number: MURA160T3G; RoHS: Yes; Item Type: Diode; Stock: 190000; Pricing: 5000=0.109, 10000=0.106, 15000=0.104, 20000=0.103, 25000=0.0996 (USD); Case/Package: SMA; Pins: 2; Min Operating Temperature: -65°C; Max Operating Temperature: 175°C; Package Quantity: 1; Packaging: Tape and Reel; Average Rectified Current: 2A; Reverse Recovery Time: 75ns; Max Repetitive Reverse Voltage (Vrrm): 600V; Peak Non-Repetitive Surge Current: 30A; Max Forward Surge Current (Ifsm): 30A; Voltage Rating (DC): 600V; Current Rating: 2A; Output Current: 1A; Max Reverse Voltage (DC): 600V; Reverse Voltage: 600V; Series: -; Reverse Recovery Time-Max: 75ns; Length: 4.32mm; Width: 2.6mm; Height: 2mm; Radiation Hardening: No; Reach SVHC Compliant: No; Lead Free: Lead Free; Halogen Free: Halogen Free; RoHS Compliant: Yes; ComponentLink1URL: https://datasheet.ciiva.com/8293/mura160t3-d-8293035.pdf?src-supplier=Avnet; ComponentLink1Description: https://datasheet.ciiva.com/8293/mura160t3-d-8293035.pdf?src-supplier=Avnet; ComponentLink2URL: https://datasheet.ciiva.com/27056/2015775-27056224.pdf?src-supplier=Jameco; ComponentLink2Description: https://datasheet.ciiva.com/27056/2015775-27056224.pdf?src-supplier=Jameco; ComponentLink3URL: https://datasheet.ciiva.com/16395/mura160t3-d-16395990.pdf?src-supplier=Future+Electronics; ComponentLink3Description: https://datasheet.ciiva.com/16395/mura160t3-d-16395990.pdf?src-supplier=Future+Electronics
D7 = SMD110PL-TP: Diode Zener Single 13V 5% 200mW 2-Pin SOD-323 T/R; Manufacturer: MCC; Item Type: Diodes; Supplier: Digikey; LCSC Part Number: C669053; Manufacturer Part Number: SMD110PL-TP; RoHS: Yes; Stock: 3669579; Pricing: 1=0.15, 10=0.105, 100=0.0702, 500=0.05344, 1000=0.04776 (USD); Lead Free: 5697LeadFree; ComponentLink1URL: https://datasheet.ciiva.com/26844/getdatasheetpartid-746365-26844934.pdf?src-supplier=Verical; ComponentLink1Description: https://datasheet.ciiva.com/26844/getdatasheetpartid-746365-26844934.pdf?src-supplier=Verical; ComponentLink2URL: https://datasheet.ciiva.com/913/smd15pl-smd1200plsod-123fl-913095.pdf?src-supplier=Digikey; ComponentLink2Description: https://datasheet.ciiva.com/913/smd15pl-smd1200plsod-123fl-913095.pdf?src-supplier=Digikey; ComponentLink3URL: https://datasheet.ciiva.com/913/smd15pl-smd1200plsod-123fl-913096.pdf?src-supplier=Digikey; ComponentLink3Description: https://datasheet.ciiva.com/913/smd15pl-smd1200plsod-123fl-913096.pdf?src-supplier=Digikey; ComponentLink4URL: https://datasheet.ciiva.com/913/smd15pl-smd1200plsod-123fl-913097.pdf?src-supplier=Digikey; ComponentLink4Description: https://datasheet.ciiva.com/913/smd15pl-smd1200plsod-123fl-913097.pdf?src-supplier=Digikey; Supplier Part Number: MMSZ5243BS-FDICT-ND; Category: Zener Diodes; ComponentLink5URL: https://datasheet.ciiva.com/8348/ds31038-8348008.pdf?src-supplier=Avnet; ComponentLink5Description: https://datasheet.ciiva.com/8348/ds31038-8348008.pdf?src-supplier=Avnet; ComponentLink6URL: https://datasheet.ciiva.com/891/ds31038-891527.pdf?src-supplier=Digikey; ComponentLink6Description: https://datasheet.ciiva.com/891/ds31038-891527.pdf?src-supplier=Digikey; ComponentLink7URL: https://datasheet.ciiva.com/891/ds31038-891528.pdf?src-supplier=Digikey; ComponentLink7Description: https://datasheet.ciiva.com/891/ds31038-891528.pdf?src-supplier=Digikey; ComponentLink8URL: https://datasheet.ciiva.com/891/ds31038-891529.pdf?src-supplier=Digikey; ComponentLink8Description: https://datasheet.ciiva.com/891/ds31038-891529.pdf?src-supplier=Digikey
D9 = MMSZ5243BS-7-F: DIODE ZENER 13V 200MW SOD323; Manufacturer: Diodes Zetex; Item Type: Diodes; Supplier: Digikey; LCSC Part Number: C5249130; Manufacturer Part Number: MMSZ5243BS-7-F; RoHS: Yes; Stock: 7247; Pricing: 1=0.15, 10=0.105, 100=0.0707, 500=0.05384, 1000=0.04814 (USD); ComponentLink1URL: https://datasheet.ciiva.com/8348/ds31038-8348008.pdf?src-supplier=Avnet; ComponentLink1Description: https://datasheet.ciiva.com/8348/ds31038-8348008.pdf?src-supplier=Avnet; ComponentLink2URL: https://datasheet.ciiva.com/891/ds31038-891527.pdf?src-supplier=Digikey; ComponentLink2Description: https://datasheet.ciiva.com/891/ds31038-891527.pdf?src-supplier=Digikey; ComponentLink3URL: https://datasheet.ciiva.com/891/ds31038-891528.pdf?src-supplier=Digikey; ComponentLink3Description: https://datasheet.ciiva.com/891/ds31038-891528.pdf?src-supplier=Digikey; ComponentLink4URL: https://datasheet.ciiva.com/891/ds31038-891529.pdf?src-supplier=Digikey; ComponentLink4Description: https://datasheet.ciiva.com/891/ds31038-891529.pdf?src-supplier=Digikey
J1 J7 = 5010: PC TEST POINT MULTIPURPOSE RED; Manufacturer: Keystone Electronics; Item Type: Connectors; Supplier: Digikey; LCSC Part Number: C2906765; Manufacturer Part Number: 5010; RoHS: Yes; Stock: 128327; Pricing: 1=0.38, 25=0.308, 100=0.3015, 250=0.28304, 500=0.2523, 1000=0.17746, 2500=0.16225, 5000=0.15211 (USD); ComponentLink1URL: https://datasheet.ciiva.com/11744/0900766b8009b7c7-11744920.pdf?src-supplier=Rs; ComponentLink1Description: https://datasheet.ciiva.com/11744/0900766b8009b7c7-11744920.pdf?src-supplier=Rs; ComponentLink2URL: https://datasheet.ciiva.com/16506/m60-2p60-16506972.pdf?src-supplier=Future+Electronics; ComponentLink2Description: https://datasheet.ciiva.com/16506/m60-2p60-16506972.pdf?src-supplier=Future+Electronics; ComponentLink3URL: https://datasheet.ciiva.com/22631/1703983-22631113.pdf?src-supplier=Element14; ComponentLink3Description: https://datasheet.ciiva.com/22631/1703983-22631113.pdf?src-supplier=Element14; ComponentLink4URL: https://datasheet.ciiva.com/16883/70182825-16883886.pdf?src-supplier=Allied+Electronics; ComponentLink4Description: https://datasheet.ciiva.com/16883/70182825-16883886.pdf?src-supplier=Allied+Electronics; ComponentLink5URL: https://datasheet.ciiva.com/2917/5010-2917626.pdf?src-supplier=Digikey; ComponentLink5Description: https://datasheet.ciiva.com/2917/5010-2917626.pdf?src-supplier=Digikey; ComponentLink6URL: https://datasheet.ciiva.com/1454/1703983-1454833.pdf?src-supplier=Element14; ComponentLink6Description: https://datasheet.ciiva.com/1454/1703983-1454833.pdf?src-supplier=Element14
J2 = 703W-00/54: PWR ENT RCPT IEC320-C14 PNL SLDR; Manufacturer: Qualtek; Item Type: Power Connectors; Supplier: Digikey; Supplier Part Number: Q220-ND; Manufacturer Part Number: 703W-00/54; RoHS: Yes; Stock: 6999; Pricing: 1=2.02, 10=1.541, 25=1.3868, 50=1.282, 100=1.1867, 300=1.0531, 500=0.99762, 1000=0.92847, 2500=0.84695 (USD); ComponentLink1URL: https://datasheet.ciiva.com/1115/703w0054-1115060.pdf?src-supplier=Newark; ComponentLink1Description: https://datasheet.ciiva.com/1115/703w0054-1115060.pdf?src-supplier=Newark; ComponentLink2URL: https://datasheet.ciiva.com/12348/703w0054-56908-12348569.pdf?src-supplier=Mouser; ComponentLink2Description: https://datasheet.ciiva.com/12348/703w0054-56908-12348569.pdf?src-supplier=Mouser; ComponentLink3URL: https://datasheet.ciiva.com/16707/70133351-16707751.pdf?src-supplier=Allied+Electronics; ComponentLink3Description: https://datasheet.ciiva.com/16707/70133351-16707751.pdf?src-supplier=Allied+Electronics; ComponentLink4URL: https://datasheet.ciiva.com/691/703w0054-691309.pdf?src-supplier=Digikey; ComponentLink4Description: https://datasheet.ciiva.com/691/703w0054-691309.pdf?src-supplier=Digikey
J3 J4 = 01020071Z: FUSE CLIP CARTRIDGE 250V 15A PCB; Manufacturer: Littelfuse; Item Type: Fuse Holder; Supplier: Digikey; LCSC Part Number: C142745; Manufacturer Part Number: 01020071Z; RoHS: Yes; Stock: 48674; Pricing: 1=0.27, 5=0.228, 10=0.21, 50=0.1754, 100=0.1622, 250=0.14612, 500=0.13502, 1000=0.12473, 5000=0.1036 (USD); Lead Free: 5697LeadFree; ComponentLink1URL: https://datasheet.ciiva.com/30471/0900766b8128f6e8-30471828.pdf?src-supplier=Rs; ComponentLink1Description: https://datasheet.ciiva.com/30471/0900766b8128f6e8-30471828.pdf?src-supplier=Rs; ComponentLink2URL: https://datasheet.ciiva.com/14119/102-series-eng-tds-14119839.pdf?src-supplier=Distrelec; ComponentLink2Description: https://datasheet.ciiva.com/14119/102-series-eng-tds-14119839.pdf?src-supplier=Distrelec; ComponentLink3URL: https://datasheet.ciiva.com/1269/1480080-1269262.pdf?src-supplier=Element14; ComponentLink3Description: https://datasheet.ciiva.com/1269/1480080-1269262.pdf?src-supplier=Element14; ComponentLink4URL: https://datasheet.ciiva.com/1270/littelfuse-fuse-clips-1270929.pdf?src-supplier=Element14; ComponentLink4Description: https://datasheet.ciiva.com/1270/littelfuse-fuse-clips-1270929.pdf?src-supplier=Element14; ComponentLink5URL: https://datasheet.ciiva.com/295/littelfuse-fuse-clips-295516.pdf?src-supplier=Digikey; ComponentLink5Description: https://datasheet.ciiva.com/295/littelfuse-fuse-clips-295516.pdf?src-supplier=Digikey; ComponentLink6URL: https://datasheet.ciiva.com/15201/getdatasheetpartid-336939-15201068.pdf?src-supplier=Verical; ComponentLink6Description: https://datasheet.ciiva.com/15201/getdatasheetpartid-336939-15201068.pdf?src-supplier=Verical
J5 J10 = 5011: PC TEST POINT MULTIPURPOSE BLACK; Manufacturer: Keystone Electronics; Item Type: Connectors; Gender: 30Gender; Inside Diameter: 1.78mm; Supplier: Digikey; LCSC Part Number: C238127; Manufacturer Part Number: 5011; RoHS: Yes; Stock: 243196; Pricing: 1=0.38, 25=0.308, 100=0.3015, 250=0.28304, 500=0.2523, 1000=0.17746, 2500=0.16225, 5000=0.15211 (USD); Length: 11.3mm; Lead Free: 5697LeadFree; ComponentLink1URL: https://datasheet.ciiva.com/11744/0900766b8009b7c7-11744935.pdf?src-supplier=Rs; ComponentLink1Description: https://datasheet.ciiva.com/11744/0900766b8009b7c7-11744935.pdf?src-supplier=Rs; ComponentLink2URL: https://datasheet.ciiva.com/1454/1718230-1454834.pdf?src-supplier=Element14; ComponentLink2Description: https://datasheet.ciiva.com/1454/1718230-1454834.pdf?src-supplier=Element14; ComponentLink3URL: https://datasheet.ciiva.com/46412/1703983-46412138.pdf?src-supplier=Element14; ComponentLink3Description: https://datasheet.ciiva.com/46412/1703983-46412138.pdf?src-supplier=Element14; ComponentLink4URL: https://datasheet.ciiva.com/16351/m60-2p60-16351093.pdf?src-supplier=Future+Electronics; ComponentLink4Description: https://datasheet.ciiva.com/16351/m60-2p60-16351093.pdf?src-supplier=Future+Electronics; ComponentLink5URL: https://datasheet.ciiva.com/2917/5011-2917635.pdf?src-supplier=Digikey; ComponentLink5Description: https://datasheet.ciiva.com/2917/5011-2917635.pdf?src-supplier=Digikey
J6 J8 = X6511WV-02H-C60D30: Gold 250V 3A Straight Square Pins 2.5mm 2P 260℃ 6mm -40℃~+105℃ 3mm 2.54mm Plugin Black Brass 1x2P Plugin,P=2.54mm Pin Headers ROHS; Manufacturer: XKB; Item Type: Male Header; Manufacturer Part Number: X6511WV-02H-C60D30; Package: Plugin,P=2.54mm; LCSC Part Number: C706874; ComponentLink1Description: LCSC; ComponentLink1URL: https://www.lcsc.com/product-detail/Pin-Headers_XKB-Connectivity-X6511WV-02H-C60D30_C706874.html
J9 = 5012: PC TEST POINT MULTIPURPOSE WHITE; Manufacturer: Keystone Electronics; Item Type: Connectors; Supplier: Digikey; LCSC Part Number: C2906766; Manufacturer Part Number: 5012; RoHS: Yes; Stock: 102631; Pricing: 1=0.38, 25=0.308, 100=0.3015, 250=0.28304, 500=0.2523, 1000=0.17746, 2500=0.16225, 5000=0.15211 (USD); ComponentLink1URL: https://datasheet.ciiva.com/27052/1582065-27052612.pdf?src-supplier=Jameco; ComponentLink1Description: https://datasheet.ciiva.com/27052/1582065-27052612.pdf?src-supplier=Jameco; ComponentLink2URL: https://datasheet.ciiva.com/16200/m60-2p60-16200039.pdf?src-supplier=Future+Electronics; ComponentLink2Description: https://datasheet.ciiva.com/16200/m60-2p60-16200039.pdf?src-supplier=Future+Electronics; ComponentLink3URL: https://datasheet.ciiva.com/22631/1703983-22631115.pdf?src-supplier=Element14; ComponentLink3Description: https://datasheet.ciiva.com/22631/1703983-22631115.pdf?src-supplier=Element14; ComponentLink4URL: https://datasheet.ciiva.com/16884/70182825-16884150.pdf?src-supplier=Allied+Electronics; ComponentLink4Description: https://datasheet.ciiva.com/16884/70182825-16884150.pdf?src-supplier=Allied+Electronics; ComponentLink5URL: https://datasheet.ciiva.com/2917/5012-2917634.pdf?src-supplier=Digikey; ComponentLink5Description: https://datasheet.ciiva.com/2917/5012-2917634.pdf?src-supplier=Digikey; ComponentLink6URL: https://datasheet.ciiva.com/1454/1703983-1454835.pdf?src-supplier=Element14; ComponentLink6Description: https://datasheet.ciiva.com/1454/1703983-1454835.pdf?src-supplier=Element14